# Altium project PGS-System.PrjPcb (part 9 of 16)

## Sheet RV1126_ETHERNET_SHEET.SchDoc
size A4; SheetNumber: 13; SheetTotal: 25
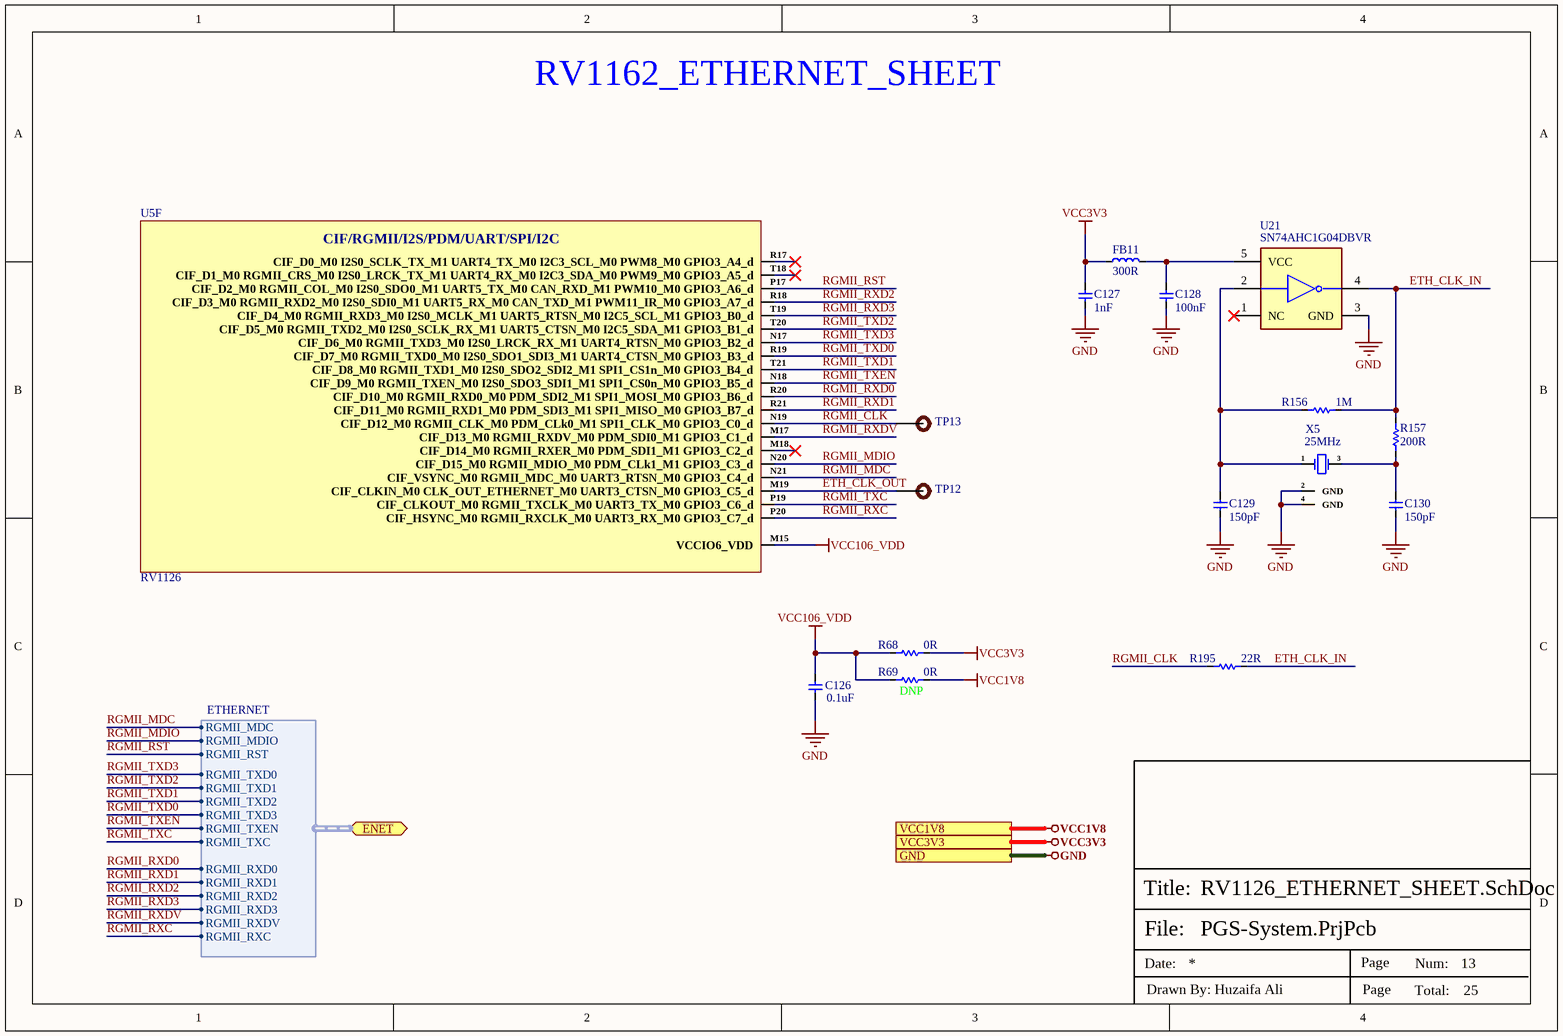
[diagram p13: RV1126_ETHERNET_SHEET.SchDoc]

### Parts
C126  0.1uF  [Cap-0402]
C127  1nF  [Cap-0402]
C128  100nF  [Cap-0402]
C129  150pF  [Cap-0402]
C130  150pF  [Cap-0402]
FB11  300R  [IND-0603 (1608 Metric)]
R68  0R  [Res-0402]
R69  DNP  [Res-0402]
R156  1M  [Res-0402]
R157  200R  [Res-0402]
R195  22R  [Res-0402]
TP12  TEST POINT 0.5mm Dia  [Test-point - 0.5mm]  (value not drawn)  (no BOM)
TP13  TEST POINT 0.5mm Dia  [Test-point - 0.5mm]  (value not drawn)  (no BOM)
U5  RV1126  [FCCSP-409(14x14)]  (part F of 15)
U21  SN74AHC1G04DBVR  [FP-DBV0005A-MFG]
X5  25MHz  [Q22FA12800090]

### Ports
ENET (bidir, harness ETHERNET, see ETHERNET_SWITCH_INTERFACE[2D]), GND (see DDR3_SDRAM_INTERFACE[4D], DIGITAL_MEMS_MIC_INTERFACE[3D], eMMC_INTERFACE[3D], ETHERNET_SWITCH_INTERFACE[5C], IR-CUT_LIGHT SENSOR_SHEET[3D], MIPI TO HDMI_MODULE_INTERFACE[3D], MIPI-CSI_RXX_INTERFACE[4C], PoE PD INTERFACE[3D], PoE_PSE_CONTROLLER[5D], POWER_LDO_SHEET[3D], POWER_PMIC_RK809_CODEC[3D], POWER_PMIC_RK809_DC DC[3D], POWER_PMIC_RK809_LDO[4C], POWER_PMIC_RK809_MANAGEMENT[3D], RV1126_AUDIO_SHEET[3D], RV1126_DRAM_SHEET[4C], RV1126_eMMC_SPI-FLASH_SHEET[3D], RV1126_OSC-PLL-PMUIO[3C], RV1126_POWER_SHEET[1D], RV1126_SARADC_SHEET[3C], SPI_FLASH_INTERFACE[3D], SYNCHRONOUS _BUCK_CONTROLLER[3D], USB2.0_DEBUG_UART[3D], WIFI_AP6256_SHEET[4D]), VCC1V8 (see DIGITAL_MEMS_MIC_INTERFACE[3D], IR-CUT_LIGHT SENSOR_SHEET[3D], MIPI TO HDMI_MODULE_INTERFACE[3D], MIPI-CSI_RXX_INTERFACE[4C], POWER_PMIC_RK809_LDO[4C], POWER_PMIC_RK809_MANAGEMENT[3D], RV1126_AUDIO_SHEET[3D], RV1126_OSC-PLL-PMUIO[3C], RV1126_SARADC_SHEET[3C], USB2.0_DEBUG_UART[3D], WIFI_AP6256_SHEET[4D]), VCC3V3 (see POWER_PMIC_RK809_LDO[4C], RV1126_SARADC_SHEET[3C], USB2.0_DEBUG_UART[3D], WIFI_AP6256_SHEET[4D])

### Harnesses
ETHERNET: RGMII_MDC, RGMII_MDIO, RGMII_RST, RGMII_TXD3, RGMII_TXD2, RGMII_TXD1, RGMII_TXD0, RGMII_TXEN, RGMII_TXC, RGMII_RXC, RGMII_RXDV, RGMII_RXD0, RGMII_RXD1, RGMII_RXD2, RGMII_RXD3

### Nets
GND: C126.1 C127.1 C128.1 C129.1 C130.1 U21.3(GND) X5.2(GND) X5.4(GND) ; port GND  [project net KSENSD]
VCC1V8: R69.2 ; port VCC1V8
VCC3V3: C127.2 FB11.2 R68.2 ; port VCC3V3
VCC106_VDD: C126.2 R68.1 R69.1 U5.M15(VCCIO6_VDD)
ETH_CLK_IN: R156.1 R157.2 R195.2 U21.4(Y)
ETH_CLK_OUT: TP12.1 U5.M19(CIF_CLKIN_M0_CLK_OUT_ETHERNET_M0_UART3_CTSN_M0_GPIO3_C5_d)
RGMII_CLK: R195.1 TP13.1 U5.N19(CIF_D12_M0_RGMII_CLK_M0_PDM_CLk0_M1_SPI1_CLK_M0_GPIO3_C0_d)
RGMII_MDC: U5.N21(CIF_VSYNC_M0_RGMII_MDC_M0_UART3_RTSN_M0_GPIO3_C4_d) ; port ENET.RGMII_MDC
RGMII_MDIO: U5.N20(CIF_D15_M0_RGMII_MDIO_M0_PDM_CLk1_M1_GPIO3_C3_d) ; port ENET.RGMII_MDIO
RGMII_RST: U5.P17(CIF_D2_M0_RGMII_COL_M0_I2S0_SDO0_M1_UART5_TX_M0_CAN_RXD_M1_PWM10_M0_GPIO3_A6_d) ; port ENET.RGMII_RST
RGMII_RXC: U5.P20(CIF_HSYNC_M0_RGMII_RXCLK_M0_UART3_RX_M0_GPIO3_C7_d) ; port ENET.RGMII_RXC
RGMII_RXD0: U5.R20(CIF_D10_M0_RGMII_RXD0_M0_PDM_SDI2_M1_SPI1_MOSI_M0_GPIO3_B6_d) ; port ENET.RGMII_RXD0
RGMII_RXD1: U5.R21(CIF_D11_M0_RGMII_RXD1_M0_PDM_SDI3_M1_SPI1_MISO_M0_GPIO3_B7_d) ; port ENET.RGMII_RXD1
RGMII_RXD2: U5.R18(CIF_D3_M0_RGMII_RXD2_M0_I2S0_SDI0_M1_UART5_RX_M0_CAN_TXD_M1_PWM11_IR_M0_GPIO3_A7_d) ; port ENET.RGMII_RXD2
RGMII_RXD3: U5.T19(CIF_D4_M0_RGMII_RXD3_M0_I2S0_MCLK_M1_UART5_RTSN_M0_I2C5_SCL_M1_GPIO3_B0_d) ; port ENET.RGMII_RXD3
RGMII_RXDV: U5.M17(CIF_D13_M0_RGMII_RXDV_M0_PDM_SDI0_M1_GPIO3_C1_d) ; port ENET.RGMII_RXDV
RGMII_TXC: U5.P19(CIF_CLKOUT_M0_RGMII_TXCLK_M0_UART3_TX_M0_GPIO3_C6_d) ; port ENET.RGMII_TXC
RGMII_TXD0: U5.R19(CIF_D7_M0_RGMII_TXD0_M0_I2S0_SDO1_SDI3_M1_UART4_CTSN_M0_GPIO3_B3_d) ; port ENET.RGMII_TXD3
RGMII_TXD1: U5.T21(CIF_D8_M0_RGMII_TXD1_M0_I2S0_SDO2_SDI2_M1_SPI1_CS1n_M0_GPIO3_B4_d) ; port ENET.RGMII_TXD2
RGMII_TXD2: U5.T20(CIF_D5_M0_RGMII_TXD2_M0_I2S0_SCLK_RX_M1_UART5_CTSN_M0_I2C5_SDA_M1_GPIO3_B1_d) ; port ENET.RGMII_TXD1
RGMII_TXD3: U5.N17(CIF_D6_M0_RGMII_TXD3_M0_I2S0_LRCK_RX_M1_UART4_RTSN_M0_GPIO3_B2_d) ; port ENET.RGMII_TXD0
RGMII_TXEN: U5.N18(CIF_D9_M0_RGMII_TXEN_M0_I2S0_SDO3_SDI1_M1_SPI1_CS0n_M0_GPIO3_B5_d) ; port ENET.RGMII_TXEN
NetC128_2: C128.2 FB11.1 U21.5(VCC)
NetC129_2: C129.2 R156.2 U21.2(A) X5.1(OSC1)
NetC130_2: C130.2 R157.1 X5.3(OSC2)

Not connected (* = marked no-connect by the designer): U5 M18(CIF_D14_M0_RGMII_RXER_M0_PDM_SDI1_M1_GPIO3_C2_d)* R17(CIF_D0_M0_I2S0_SCLK_TX_M1_UART4_TX_M0_I2C3_SCL_M0_PWM8_M0_GPIO3_A4_d)* T18(CIF_D1_M0_RGMII_CRS_M0_I2S0_LRCK_TX_M1_UART4_RX_M0_I2C3_SDA_M0_PWM9_M0_GPIO3_A5_d)*; U21 1(NC)*

### Notes on the sheet
- RV1162_ETHERNET_SHEET
- (near R69) 0R
- File:
- Title:
- Date:
- Page
- Num:
- Total:
- Drawn By: Huzaifa Ali
- (in symbol RV1126, part F) CIF/RGMII/I2S/PDM/UART/SPI/I2C

### Library data of the parts
C126 = CC0402KRX5R6BB104: as C33 on sheet POWER_PMIC_RK809_MGM; Supplier 1: Digi-Key; Manufacturer Part Number: CC0402KRX5R6BB104; RoHS: Yes; Category: Ceramic Capacitors; Stock 1: 6385580; Pricing 1: 1=0.10000, 10=0.02700, 50=0.01500, 100=0.01220, 500=0.00874, 1000=0.00687, 2500=0.00625, 5000=0.00575 (USD); Mount: Surface Mount; Case/Package: 0402; Number of Pins: 2; Case Code (Imperial): 0402; Case Code (Metric): 1005; Min Operating Temperature: -55°C; Max Operating Temperature: 85°C; Dielectric: X5R; Packaging: Tape and Reel; Voltage Rating: 10V; Package Quantity: 1; Termination: SMD/SMT; Voltage Rating (DC): 10V; Series: CC; Length: 1mm; Width: 0.02inch; Height: 0.5mm; Depth: 0.5mm; Thickness: 0.022inch; Radiation Hardening: No; RoHS Compliant: Yes; REACH SVHC: No SVHC; Lead Free: Lead Free; Halogen Free: Halogen Free; ComponentLink1URL: https://datasheet.ciiva.com/144/mlccorderingcode-144029.pdf?src-supplier=Digi-Key; ComponentLink1Description: https://datasheet.ciiva.com/144/mlccorderingcode-144029.pdf?src-supplier=Digi-Key; ComponentLink2URL: https://datasheet.ciiva.com/144/mlccorderingcode-144028.pdf?src-supplier=Digi-Key; ComponentLink2Description: https://datasheet.ciiva.com/144/mlccorderingcode-144028.pdf?src-supplier=Digi-Key; ComponentLink3URL: https://datasheet.ciiva.com/144/mlccorderingcode-144030.pdf?src-supplier=Digi-Key; ComponentLink3Description: https://datasheet.ciiva.com/144/mlccorderingcode-144030.pdf?src-supplier=Digi-Key; ComponentLink4URL: https://datasheet.ciiva.com/7978/1359354-7978091.pdf?src-supplier=Element14; ComponentLink4Description: https://datasheet.ciiva.com/7978/1359354-7978091.pdf?src-supplier=Element14; ComponentLink5URL: https://datasheet.ciiva.com/11587/upy-gphc-x5r-4v-to-50v-12-11587302.pdf?src-supplier=Avnet; ComponentLink5Description: https://datasheet.ciiva.com/11587/upy-gphc-x5r-4v-to-50v-12-11587302.pdf?src-supplier=Avnet; Supplier Part Number 1: 311-1336-1-ND; LCSC Part Number: C129131
C127 = C1005C0G1E102JT000F: CAP CER 1000PF 25V C0G 0402; Manufacturer: TDK; Item Type: Capacitor; ComponentLink1Description: LCSC; ComponentLink1URL: https://www.lcsc.com/product-detail/Multilayer-Ceramic-Capacitors-MLCC-SMD-SMT_TDK-C1005C0G1E102JT000F_C343059.html; Manufacturer Part Number: C1005C0G1E102JT000F; Package: 0402; LCSC Part Number: C343059
C128 = CC0402JRX7R7BB104: CAP CER 0.1UF 16V X7R 0402; Manufacturer: Yageo; Material: 4241ConductorMaterial; Tolerance: 5%; Item Type: Capacitor; Supplier: Digikey; Supplier Part Number: 311-1676-1-ND; Manufacturer Part Number: CC0402JRX7R7BB104; RoHS: Yes; Category: Ceramic Capacitors; Stock: 1659111; Pricing: 1=0.1, 10=0.046, 50=0.0262, 100=0.0203, 500=0.01528, 1000=0.012, 2500=0.01091, 5000=0.01004 (USD); Mounting Technology: Surface Mount; Case/Package: 0402; Case Code (Metric): 1005; Case Code (Imperial): 0402; Min Operating Temperature: -55°C; Max Operating Temperature: 125°C; Value: 100nF; Dielectric: X7R; Packaging: Tape and Reel; Package Quantity: 10000; Voltage Rating (DC): 16V; Voltage Rating: 16V; Series: CC; Construction: Flat; Length: 0.039inch; Width: 0.02inch; Height: 0.5mm; Thickness: 0.022inch; Lead Free: Lead Free; Halogen Free: Halogen Free; RoHS Compliant: Yes; ComponentLink1URL: https://datasheet.ciiva.com/13210/upy-gphc-x7r-6-3v-to-50v-8-12304-13210152.pdf?src-supplier=Mouser; ComponentLink1Description: https://datasheet.ciiva.com/13210/upy-gphc-x7r-6-3v-to-50v-8-12304-13210152.pdf?src-supplier=Mouser; LCSC Part Number: C541464
C129 C130 = CC0402KRX7R8BB151: CAP CER 150PF 25V X7R 0402; Manufacturer: Yageo; Tolerance: 10%; Item Type: Capacitor; Supplier: Future Electronics; Supplier Part Number: 2069488; Manufacturer Part Number: CC0402KRX7R8BB151; RoHS: Yes; Category: Ceramic Capacitors; Stock: 40000; Pricing: 10000=0.0032, 40000=0.003, 150000=0.0029, 400000=0.0028, 1000000=0.0026 (USD); Mounting Technology: Surface Mount; Case/Package: 0402; Case Code (Imperial): 0402; Case Code (Metric): 1005; Weight: 2.3E-05oz; Min Operating Temperature: -55°C; Max Operating Temperature: 125°C; Value: 150pF; Packaging: Tape and Reel; Voltage Rating (DC): 25V; Dielectric: X7R; Voltage Rating: 25V; Termination: SMD/SMT; Series: CC; Length: 0.039inch; Width: 0.02inch; Thickness: 0.022inch; Lead Free: Lead Free; Halogen Free: Halogen Free; RoHS Compliant: Yes; ComponentLink1URL: https://datasheet.ciiva.com/13210/upy-gphc-x7r-6-3v-to-50v-8-12304-13210062.pdf?src-supplier=Mouser; ComponentLink1Description: https://datasheet.ciiva.com/13210/upy-gphc-x7r-6-3v-to-50v-8-12304-13210062.pdf?src-supplier=Mouser; LCSC Part Number: C541384
FB11 = 742792641: FERRITE BEAD 300 OHM 0603 1LN; Manufacturer: Wurth Electronics; RMS Current (Irms): 2A; ESR: 150mR; Tolerance: 25%; Number of Lines: 1; Test Frequency: 100MHz; Value: 18nH; Supplier: Digikey; LCSC Part Number: C2649308; Manufacturer Part Number: 742792641; RoHS: Yes; Item Type: Ferrite Bead; Stock: 95770; Pricing: 1=0.18, 50=0.179, 100=0.165, 500=0.158, 1000=0.15, 2000=0.143 (USD); Mounting Technology: Surface Mount; Case/Package: SMD/SMT; Weight: 0.000141oz; Core Material: Ferrite; Case Code (Metric): 1608; Case Code (Imperial): 0603; Material: Ferrite; Min Operating Temperature: -55°C; Max Operating Temperature: 125°C; Package Quantity: 1; Current Rating: 2A; Packaging: Tape and Reel; Impedance: 300R; Max Current Rating: 2A; Max DC Current: 2A; Termination: SMD/SMT; Series: WE-CBF; Length: 1.6mm; Width: 0.8mm; Height: 0.8mm; Depth: 0.8mm; Lead Free: Lead Free; Reach SVHC Compliant: Unknown; RoHS Compliant: Yes; ComponentLink1URL: https://datasheet.ciiva.com/1466/1705830-1466501.pdf?src-supplier=Element14; ComponentLink1Description: https://datasheet.ciiva.com/1466/1705830-1466501.pdf?src-supplier=Element14; ComponentLink2URL: https://datasheet.ciiva.com/11800/0900766b80d2e072-11800409.pdf?src-supplier=Rs; ComponentLink2Description: https://datasheet.ciiva.com/11800/0900766b80d2e072-11800409.pdf?src-supplier=Rs; ComponentLink3URL: https://datasheet.ciiva.com/4940/742792641-72209-4940450.pdf?src-supplier=Mouser; ComponentLink3Description: https://datasheet.ciiva.com/4940/742792641-72209-4940450.pdf?src-supplier=Mouser; ComponentLink4URL: https://datasheet.ciiva.com/1013/742792641-1013888.pdf?src-supplier=Digikey; ComponentLink4Description: https://datasheet.ciiva.com/1013/742792641-1013888.pdf?src-supplier=Digikey; ComponentLink5URL: https://datasheet.ciiva.com/1466/1705830-1466502.pdf?src-supplier=Element14; ComponentLink5Description: https://datasheet.ciiva.com/1466/1705830-1466502.pdf?src-supplier=Element14; ComponentLink6URL: https://datasheet.ciiva.com/1013/742792641-1013889.pdf?src-supplier=Digikey; ComponentLink6Description: https://datasheet.ciiva.com/1013/742792641-1013889.pdf?src-supplier=Digikey
R68 = RC0402FR-070RL: as R20 on sheet POWER_PMIC_RK809_CODEC; Supplier 1: Mouser; Manufacturer Part Number: RC0402FR-070RL; RoHS: Yes; Stock 1: 8556842; Pricing 1: 1=0.10000, 10=0.01400, 50=0.01400, 100=0.00600, 1000=0.00300, 5000=0.00200, 10000=0.00100 (USD); Mount: Surface Mount; Case/Package: 0402; Contact Plating: Tin,Matte; Case Code (Imperial): 0402; Case Code (Metric): 1005; Size Code: 0402; Min Operating Temperature: -55°C; Max Operating Temperature: 155°C; Resistance: 0R; Resistor Type: Thick Film; Packaging: Tape and Reel; Termination: SMD/SMT; Features: Moisture Resistant; Series: RC; Number of Terminations: 2; Length: 1mm; Width: 0.5mm; Height: 0.35mm; Radiation Hardening: No; Lead Free: Lead Free; RoHS Compliant: Yes; ComponentLink1URL: https://datasheet.ciiva.com/8896/pyu-rc0402-51-rohs-l-6-8896149.pdf?src-supplier=Avnet; ComponentLink1Description: https://datasheet.ciiva.com/8896/pyu-rc0402-51-rohs-l-6-8896149.pdf?src-supplier=Avnet; ComponentLink2URL: https://datasheet.ciiva.com/16790/pyu-rc0402-51-rohs-l-6-r-16790444.pdf?src-supplier=Future+Electronics; ComponentLink2Description: https://datasheet.ciiva.com/16790/pyu-rc0402-51-rohs-l-6-r-16790444.pdf?src-supplier=Future+Electronics; Supplier Part Number 1: 603-RC0402FR-070RL; LCSC Part Number: C106231
R69 = RC0402FR-070RL: RES 0 OHM JUMPER 1/16W 0402; Manufacturer: Yageo; Item Type: Resistors; Resistance: 0R; Tolerance: 1%; Power Rating: 62.5mW; Voltage Rating: 50V; Temperature Coefficient: 200ppm/°C; Max Power Dissipation: 63mW; Supplier 1: Mouser; Manufacturer Part Number: RC0402FR-070RL; RoHS: Yes; Stock 1: 8556842; Pricing 1: 1=0.10000, 10=0.01400, 50=0.01400, 100=0.00600, 1000=0.00300, 5000=0.00200, 10000=0.00100 (USD); Mount: Surface Mount; Case/Package: 0402; Contact Plating: Tin,Matte; Case Code (Imperial): 0402; Case Code (Metric): 1005; Size Code: 0402; Min Operating Temperature: -55°C; Max Operating Temperature: 155°C; Resistor Type: Thick Film; Packaging: Tape and Reel; Termination: SMD/SMT; Features: Moisture Resistant; Series: RC; Number of Terminations: 2; Length: 1mm; Width: 0.5mm; Height: 0.35mm; Radiation Hardening: No; Lead Free: Lead Free; RoHS Compliant: Yes; ComponentLink1URL: https://datasheet.ciiva.com/8896/pyu-rc0402-51-rohs-l-6-8896149.pdf?src-supplier=Avnet; ComponentLink1Description: https://datasheet.ciiva.com/8896/pyu-rc0402-51-rohs-l-6-8896149.pdf?src-supplier=Avnet; ComponentLink2URL: https://datasheet.ciiva.com/16790/pyu-rc0402-51-rohs-l-6-r-16790444.pdf?src-supplier=Future+Electronics; ComponentLink2Description: https://datasheet.ciiva.com/16790/pyu-rc0402-51-rohs-l-6-r-16790444.pdf?src-supplier=Future+Electronics; Supplier Part Number 1: 603-RC0402FR-070RL; LCSC Part Number: C106231
R156 = AF0402JR-071ML: RES SMD 1M OHM 5% 1/16W 0402; Manufacturer: Yageo; Resistance: 1MR; Max Power Dissipation: 63mW; Temperature Coefficient: 100ppm/°C; Item Type: Resistor; Supplier 1: Digi-Key; Manufacturer Part Number: AF0402JR-071ML; Stock 1: 0; Pricing 1: 10000=0.00408 (USD); Case/Package: 0402; Min Operating Temperature: -55°C; Max Operating Temperature: 155°C; Packaging: Tape and Reel; Resistor Type: Thick Film; Number of Terminations: 2; Tolerance: 5%; Features: Moisture Resistant,Anti-Sulfur; Length: 0.039inch; Width: 0.02inch; Height: 0.015inch; RoHS Compliant: Yes; ComponentLink1URL: https://www.yageo.com/upload/media/product/productsearch/datasheet/rchip/PYu-AF_51_RoHS_L_6.pdf?src-supplier=Digi-Key; ComponentLink1Description: https://www.yageo.com/upload/media/product/productsearch/datasheet/rchip/PYu-AF_51_RoHS_L_6.pdf?src-supplier=Digi-Key; Supplier Part Number 1: AF0402JR-071ML-ND; LCSC Part Number: C144054
R157 = RC0402FR-07200RL: RES 200 OHM 1% 1/16W 0402; Manufacturer: Yageo; Temperature Coefficient: 100ppm/°C; Power Rating: 63mW; Voltage Rating (DC): 50V; Supplier 1: Digi-Key; Manufacturer Part Number: RC0402FR-07200RL; RoHS: Yes; Category: Chip SMD Resistors; Stock 1: 19778; Pricing 1: 1=0.10000, 10=0.01600, 100=0.00660, 1000=0.00299, 2500=0.00259, 5000=0.00214 (USD); Case/Package: 0402; Case Code (Metric): 1005; Case Code (Imperial): 0402; Size Code: 0402; Min Operating Temperature: -55°C; Max Operating Temperature: 155°C; Tolerance: 1%; Resistance: 200R; Resistor Type: Thick Film; Packaging: Tape and Reel; Voltage Rating: 50V; Package Quantity: 1; Number of Terminations: 2; Termination: SMD/SMT; Max Power Dissipation: 63mW; Features: Moisture Resistant; Series: RC; Construction: Rectangular; Resistance Tolerance: 1%; Length: 1mm; Width: 0.02inch; Height: 0.016inch; Depth: 0.5mm; REACH SVHC: No SVHC; Lead Free: Lead Free; RoHS Compliant: Yes; Military Standard: Not; ComponentLink1URL: https://datasheet.ciiva.com/2553/pyu-r-int-thick-7-2553232.pdf?src-supplier=Digi-Key; ComponentLink1Description: https://datasheet.ciiva.com/2553/pyu-r-int-thick-7-2553232.pdf?src-supplier=Digi-Key; ComponentLink2URL: https://datasheet.ciiva.com/7983/1018594-7983509.pdf?src-supplier=Element14; ComponentLink2Description: https://datasheet.ciiva.com/7983/1018594-7983509.pdf?src-supplier=Element14; ComponentLink3URL: https://datasheet.ciiva.com/16804/pyu-rc0402-51-rohs-l-6-r-16804406.pdf?src-supplier=Future+Electronics; ComponentLink3Description: https://datasheet.ciiva.com/16804/pyu-rc0402-51-rohs-l-6-r-16804406.pdf?src-supplier=Future+Electronics; ComponentLink4URL: https://datasheet.ciiva.com/15189/getdatasheetpartid-331152-15189383.pdf?src-supplier=Verical; ComponentLink4Description: https://datasheet.ciiva.com/15189/getdatasheetpartid-331152-15189383.pdf?src-supplier=Verical; ComponentLink5URL: https://datasheet.ciiva.com/7849/1018594-7849898.pdf?src-supplier=Element14; ComponentLink5Description: https://datasheet.ciiva.com/7849/1018594-7849898.pdf?src-supplier=Element14; ComponentLink6URL: https://datasheet.ciiva.com/5562/pyu-rc0402-51-rohs-l-6-r-8721-5562539.pdf?src-supplier=Mouser; ComponentLink6Description: https://datasheet.ciiva.com/5562/pyu-rc0402-51-rohs-l-6-r-8721-5562539.pdf?src-supplier=Mouser; ComponentLink7URL: https://datasheet.ciiva.com/7849/1018594-7849899.pdf?src-supplier=Element14; ComponentLink7Description: https://datasheet.ciiva.com/7849/1018594-7849899.pdf?src-supplier=Element14; ComponentLink8URL: https://datasheet.ciiva.com/2553/pyu-r-int-thick-7-2553230.pdf?src-supplier=Digi-Key; ComponentLink8Description: https://datasheet.ciiva.com/2553/pyu-r-int-thick-7-2553230.pdf?src-supplier=Digi-Key; ComponentLink9URL: https://datasheet.ciiva.com/2553/pyu-r-int-thick-7-2553231.pdf?src-supplier=Digi-Key; ComponentLink9Description: https://datasheet.ciiva.com/2553/pyu-r-int-thick-7-2553231.pdf?src-supplier=Digi-Key; Supplier Part Number 1: 311-200LRCT-ND; LCSC Part Number: C114764
R195 = RC0402FR-0722RL: as R10 on sheet POWER_PMIC_RK809_MGM; Supplier 1: Avnet; Manufacturer Part Number: RC0402FR-0722RL; RoHS: Yes; Category: Chip SMD Resistors; Stock 1: 1810000; Pricing 1: 10000=0.00085 (USD); Case/Package: 0402; Number of Pins: 2; Case Code (Imperial): 0402; Case Code (Metric): 1005; Size Code: 0402; Min Operating Temperature: -55°C; Max Operating Temperature: 155°C; Resistor Type: Thick Film; Voltage Rating (DC): 50V; Resistance: 22R; Tolerance: 1%; Packaging: Tape and Reel; Termination: SMD/SMT; Features: Moisture Resistant; Series: RC; Number of Terminations: 2; Resistance Tolerance: 1%; Technology: THICK FILM; Construction: Rectangular; Length: 1mm; Width: 0.5mm; Height: 0.32mm; Depth: 0.5mm; RoHS Compliant: Yes; Reach SVHC Compliant: Yes; Military Standard: Not; Lead Free: Lead Free; ComponentLink1URL: https://datasheet.ciiva.com/11819/0900766b80c66297-11819462.pdf?src-supplier=RSComponents; ComponentLink1Description: https://datasheet.ciiva.com/11819/0900766b80c66297-11819462.pdf?src-supplier=RSComponents; ComponentLink2URL: https://datasheet.ciiva.com/7849/1018594-7849912.pdf?src-supplier=Element14; ComponentLink2Description: https://datasheet.ciiva.com/7849/1018594-7849912.pdf?src-supplier=Element14; ComponentLink3URL: https://datasheet.ciiva.com/7849/1018594-7849911.pdf?src-supplier=Element14; ComponentLink3Description: https://datasheet.ciiva.com/7849/1018594-7849911.pdf?src-supplier=Element14; ComponentLink4URL: https://datasheet.ciiva.com/16930/pyu-rc0402-51-rohs-l-6-r-16930687.pdf?src-supplier=Future+Electronics; ComponentLink4Description: https://datasheet.ciiva.com/16930/pyu-rc0402-51-rohs-l-6-r-16930687.pdf?src-supplier=Future+Electronics; ComponentLink5URL: https://datasheet.ciiva.com/26829/getdatasheetpartid-554995-26829991.pdf?src-supplier=Verical; ComponentLink5Description: https://datasheet.ciiva.com/26829/getdatasheetpartid-554995-26829991.pdf?src-supplier=Verical; Supplier Part Number 1: RC0402FR-0722RL; LCSC Part Number: C114765
TP12 TP13 = TEST POINT 0.5mm Dia: Test Point ON; Item Type: Test Point; Manufacturer Part Number: TEST POINT 0.5mm Dia
U5 = RV1126: as U5 on sheet RV1126_POWER_SHEET; Manufacturer Part Number: RV1126; Package: FCCSP-409(14x14); LCSC Part Number: C2859017; Item Type: Microcontroller; ComponentLink1Description: LCSC; ComponentLink1URL: https://www.lcsc.com/product-detail/Microcontroller-Units-MCUs-MPUs-SOCs_Rockchip-RV1126_C2859017.html
U21 = CMP-0859-00023-4: IC INVERTER 1CH 1-INP SOT23-5; Manufacturer: Texas Instruments; Nominal Supply Current: 1uA; Number Of Circuits: 1; Logic Function Desc: Inverting; Max Junction Temp: +150°C; Max Supply Voltage: 5.5V; Min Supply Voltage: 2V; Standoff Height: 0mm; Propagation Delay: 5.3ns; Ambient Temperature Range High: +125°C; Ambient Temperature Range Low: -40°C; Category: IC; ComponentLink2Description: Datasheet; Octopart: https://octopart.com/sn74ahc1g04dbvr-texas+instruments-464402; Temperature Range Low: -40°C; Height: 1.45mm; Digikey Description: IC INVERTER 1CH 1-INP SOT23-5; RoHS: TRUE; Temperature Range High: +125°C; Device Class L2: Logic ICs; ComponentLink2URL: http://www.ti.com/lit/ds/symlink/sn74ahc1g04.pdf; Package: DBV0005A; Automotive: No; Device Class L3: Logic Gates; Number Of Outputs: 1; Number Of Inputs: 1; Lead Free: Yes; Mouser Description: IC: digital; inverter; Channels: 1; Inputs: 1; SMD; SOT23-5; 2÷5.5VDC; Temperature: -40°C to +125°C; Device Class L1: Integrated Circuits (ICs); Manufacturer Part Number: SN74AHC1G04DBVR; Ipc Land Pattern Name: SOT95P280X145-5
X5 = Q22FA12800090: CRYSTAL 25.0000MHZ 12PF SMD; Manufacturer: Seiko Epson; ComponentLink1Description: LCSC; ComponentLink1URL: https://www.lcsc.com/product-detail/Crystals_Seiko-Epson-Q22FA12800090_C255883.html; Manufacturer Part Number: Q22FA12800090; Package: SMD2016-4P; LCSC Part Number: C255883; Item Type: Crystal

## Sheet RV1126_eMMC_SPI-FLASH.SchDoc
size A4; SheetNumber: 14; SheetTotal: 26
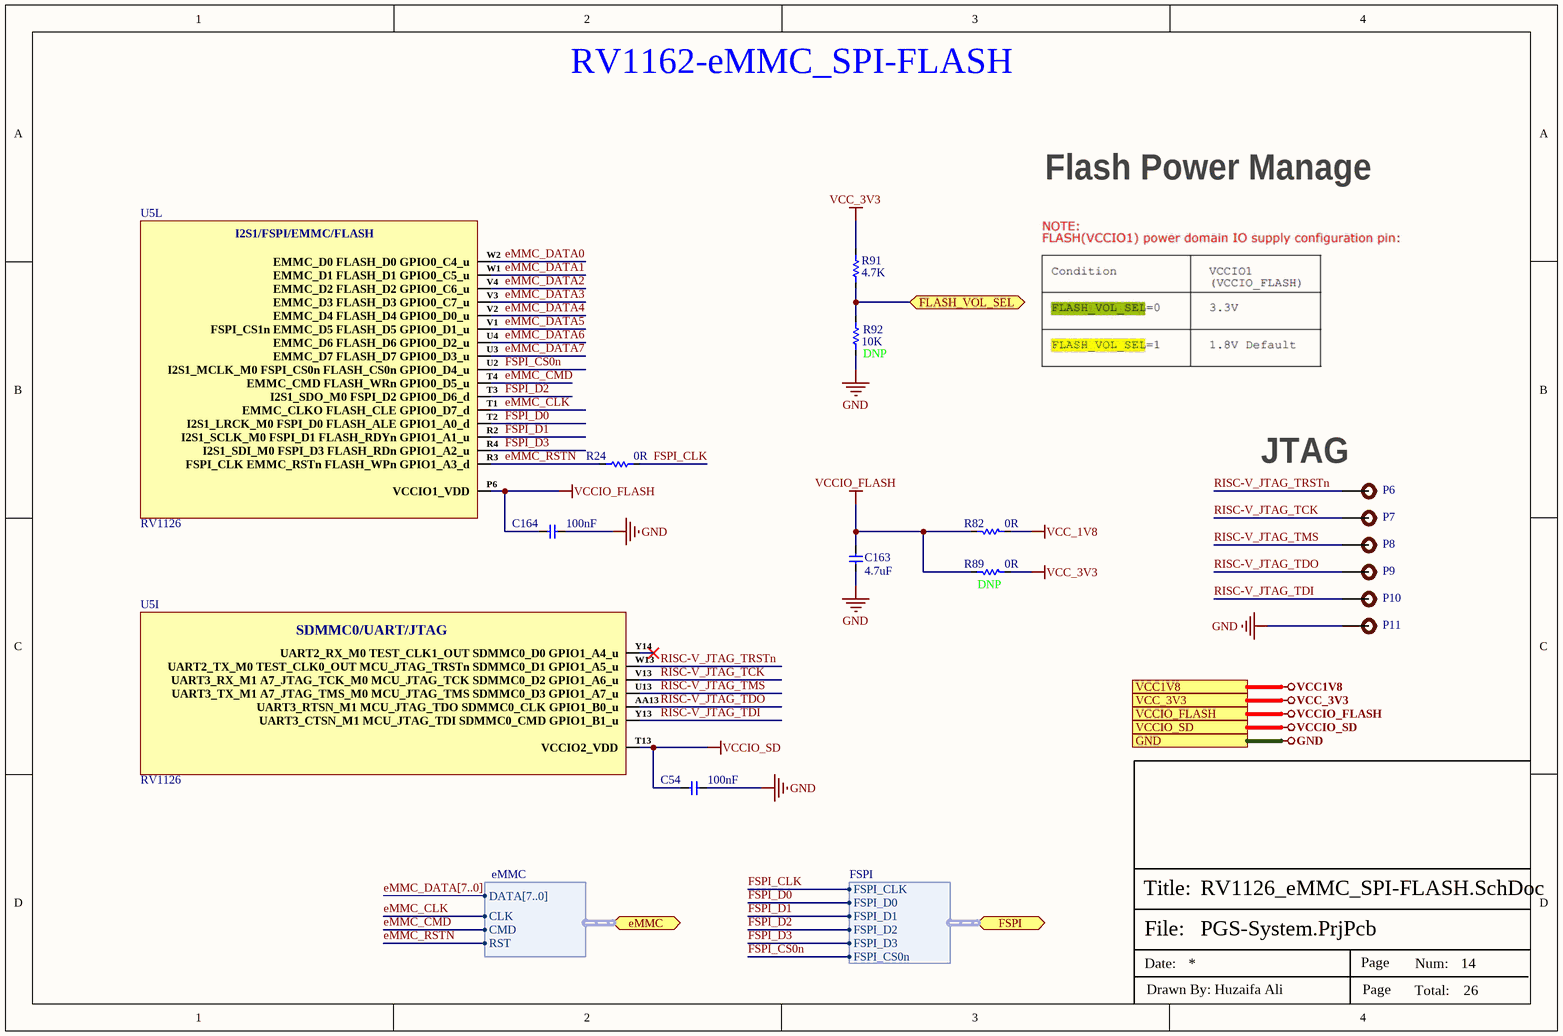
[diagram p14: RV1126_eMMC_SPI-FLASH.SchDoc]

### Parts
C54  100nF  [CAP-0201]
C163  4.7uF  [Cap-0402]
C164  100nF  [CAP-0201]
P6  TEST POINT 0.5mm Dia  [Test-point - 0.5mm]  (value not drawn)  (no BOM)
P7  TEST POINT 0.5mm Dia  [Test-point - 0.5mm]  (value not drawn)  (no BOM)
P8  TEST POINT 0.5mm Dia  [Test-point - 0.5mm]  (value not drawn)  (no BOM)
P9  TEST POINT 0.5mm Dia  [Test-point - 0.5mm]  (value not drawn)  (no BOM)
P10  TEST POINT 0.5mm Dia  [Test-point - 0.5mm]  (value not drawn)  (no BOM)
P11  TEST POINT 0.5mm Dia  [Test-point - 0.5mm]  (value not drawn)  (no BOM)
R24  0R  [Res-0402]
R82  0R  [Res-0603]
R89  DNP  [Res-0603]
R91  4.7K  [Res-0402]
R92  DNP  [Res-0402]
U5  RV1126  [FCCSP-409(14x14)]  (parts I,L of 15)

### Ports
eMMC (bidir, harness eMMC, see eMMC_INTERFACE[2D]), FLASH_VOL_SEL (bidir, see RV1126_OSC-PLL-PMUIO[3D]), FSPI (bidir, harness FSPI, see SPI_FLASH_INTERFACE[2D]), GND (see DDR3_SDRAM_INTERFACE[5D], DEBUG_UART_INTERFACE[3D], DIGITAL_MEMS_MIC_INTERFACE[3C], eMMC_INTERFACE[3D], ETHERNET_SWITCH_INTERFACE[5D], IR-CUT_LIGHT SENSOR_SHEET[3D], MIPI TO HDMI_MODULE_INTERFACE[3D], MIPI-CSI_RXX_INTERFACE[4C], PoE PD INTERFACE[3D], PoE_PSE_CONTROLLER[5D], POWER_LDO_SHEET[3D], POWER_PMIC_RK809_CODEC[3D], POWER_PMIC_RK809_DC DC[3D], POWER_PMIC_RK809_LDO[4C], POWER_PMIC_RK809_MANAGEMENT[3D], RV1126_AUDIO_SHEET[3D], RV1126_DRAM_SHEET[4C], RV1126_ETHERNET_SHEET[3D], RV1126_OSC-PLL-PMUIO[3C], RV1126_POWER_SHEET[1D], RV1126_SARADC_SHEET[3C], SPI_FLASH_INTERFACE[3D], SYNCHRONOUS _BUCK_CONTROLLER[3D], USB2.0_DEBUG_UART[3D], WIFI_AP6256_SHEET[3C]), VCC1V8 (see DIGITAL_MEMS_MIC_INTERFACE[3C], IR-CUT_LIGHT SENSOR_SHEET[3D], MIPI TO HDMI_MODULE_INTERFACE[3D], MIPI-CSI_RXX_INTERFACE[4C], POWER_PMIC_RK809_LDO[4C], POWER_PMIC_RK809_MANAGEMENT[3D], RV1126_AUDIO_SHEET[3D], RV1126_ETHERNET_SHEET[3D], RV1126_OSC-PLL-PMUIO[3C], RV1126_SARADC_SHEET[3C], USB2.0_DEBUG_UART[3D], WIFI_AP6256_SHEET[3C]), VCC_3V3 (see eMMC_INTERFACE[3D]), VCCIO_FLASH (see eMMC_INTERFACE[3D], SPI_FLASH_INTERFACE[3D]), VCCIO_SD (see POWER_PMIC_RK809_LDO[4C])

### Harnesses
FSPI: FSPI_D2, FSPI_CLK, FSPI_D0, FSPI_D1, FSPI_CS0n, FSPI_D3
eMMC: DATA[7..0], CLK, CMD, RST

### Nets
GND: C54.1 C163.1 C164.1 P11.1 R92.2 ; port GND  [project net KSENSD]
VCC_1V8: R82.1
VCC_3V3: R89.1 R91.1 ; port VCC_3V3
VCCIO_FLASH: C163.2 C164.2 R82.2 R89.2 U5.P6(VCCIO1_VDD) ; port VCCIO_FLASH
VCCIO_SD: C54.2 U5.T13(VCCIO2_VDD) ; port VCCIO_SD
eMMC_CLK: U5.T1(EMMC_CLKO_FLASH_CLE_GPIO0_D7_d) ; port eMMC.CLK
eMMC_CMD: U5.T4(EMMC_CMD_FLASH_WRn_GPIO0_D5_u) ; port eMMC.CMD
eMMC_DATA0: U5.W2(EMMC_D0_FLASH_D0_GPIO0_C4_u)
eMMC_DATA1: U5.W1(EMMC_D1_FLASH_D1_GPIO0_C5_u)
eMMC_DATA2: U5.V4(EMMC_D2_FLASH_D2_GPIO0_C6_u)
eMMC_DATA3: U5.V3(EMMC_D3_FLASH_D3_GPIO0_C7_u)
eMMC_DATA4: U5.V2(EMMC_D4_FLASH_D4_GPIO0_D0_u)
eMMC_DATA5: U5.V1(FSPI_CS1n_EMMC_D5_FLASH_D5_GPIO0_D1_u)
eMMC_DATA6: U5.U4(EMMC_D6_FLASH_D6_GPIO0_D2_u)
eMMC_DATA7: U5.U3(EMMC_D7_FLASH_D7_GPIO0_D3_u)
eMMC_RSTN: R24.1 U5.R3(FSPI_CLK_EMMC_RSTn_FLASH_WPn_GPIO1_A3_d) ; port eMMC.RST
FLASH_VOL_SEL: R91.2 R92.1 ; port FLASH_VOL_SEL
FSPI_CLK: R24.2 ; port FSPI.FSPI_CLK
FSPI_CS0n: U5.U2(I2S1_MCLK_M0_FSPI_CS0n_FLASH_CS0n_GPIO0_D4_u) ; port FSPI.FSPI_CS0n
FSPI_D0: U5.T2(I2S1_LRCK_M0_FSPI_D0_FLASH_ALE_GPIO1_A0_d) ; port FSPI.FSPI_D0
FSPI_D1: U5.R2(I2S1_SCLK_M0_FSPI_D1_FLASH_RDYn_GPIO1_A1_u) ; port FSPI.FSPI_D1
FSPI_D2: U5.T3(I2S1_SDO_M0_FSPI_D2_GPIO0_D6_d) ; port FSPI.FSPI_D2
FSPI_D3: U5.R4(I2S1_SDI_M0_FSPI_D3_FLASH_RDn_GPIO1_A2_u) ; port FSPI.FSPI_D3
RISC-V_JTAG_TCK: P7.1 U5.V13(UART3_RX_M1_A7_JTAG_TCK_M0_MCU_JTAG_TCK_SDMMC0_D2_GPIO1_A6_u)
RISC-V_JTAG_TDI: P10.1 U5.Y13(UART3_CTSN_M1_MCU_JTAG_TDI_SDMMC0_CMD_GPIO1_B1_u)
RISC-V_JTAG_TDO: P9.1 U5.AA13(UART3_RTSN_M1_MCU_JTAG_TDO_SDMMC0_CLK_GPIO1_B0_u)
RISC-V_JTAG_TMS: P8.1 U5.U13(UART3_TX_M1_A7_JTAG_TMS_M0_MCU_JTAG_TMS_SDMMC0_D3_GPIO1_A7_u)
RISC-V_JTAG_TRSTn: P6.1 U5.W13(UART2_TX_M0_TEST_CLK0_OUT_MCU_JTAG_TRSTn_SDMMC0_D1_GPIO1_A5_u)

Not connected (* = marked no-connect by the designer): U5 Y14(UART2_RX_M0_TEST_CLK1_OUT_SDMMC0_D0_GPIO1_A4_u)*

### Buses and harness runs
bus eMMC_DATA[7..0]

### Notes on the sheet
- RV1162-eMMC_SPI-FLASH
- Flash Power Manage
- (near R92) 10K
- JTAG
- (near R89) 0R
- File:
- Title:
- Date:
- Page
- Num:
- Total:
- Drawn By: Huzaifa Ali
- (in symbol RV1126, part I) SDMMC0/UART/JTAG
- (in symbol RV1126, part L) I2S1/FSPI/EMMC/FLASH

### Library data of the parts
C54 C164 = CC0201KRX5R6BB104: as C88-C91 on sheet RV1126_POWER_SHEET; Supplier 1: Mouser; Manufacturer Part Number: CC0201KRX5R6BB104; RoHS: Yes; Category: Ceramic Capacitors; Stock 1: 824403; Pricing 1: 1=0.10000, 10=0.02400, 50=0.02400, 100=0.01900, 1000=0.01100, 10000=0.00900 (USD); Mount: Surface Mount; Case/Package: 0201; Case Code (Imperial): 0201; Case Code (Metric): 0603; Weight: 6E-06oz; Min Operating Temperature: -55°C; Max Operating Temperature: 85°C; Capacitance: 100nF; Dielectric: X5R; Voltage Rating (DC): 10V; Packaging: Tape and Reel; Termination: SMD/SMT; Resistor Type: Ceramic; Voltage Rating: 10V; Series: CC; Construction: Flat; Length: 0.6mm; Width: 0.012inch; Height: 0.3mm; Thickness: 0.013inch; Depth: 0.3mm; Radiation Hardening: No; Lead Free: Lead Free; Halogen Free: Halogen Free; RoHS Compliant: Yes; ComponentLink1URL: https://datasheet.ciiva.com/11587/upy-gphc-x5r-4v-to-50v-12-11587190.pdf?src-supplier=Avnet; ComponentLink1Description: https://datasheet.ciiva.com/11587/upy-gphc-x5r-4v-to-50v-12-11587190.pdf?src-supplier=Avnet; Supplier Part Number 1: 603-CC201KRX5R6BB104; LCSC Part Number: C190183
C163 = CC0402KRX5R6BB475: CAP CER 4.7UF 10V X5R 0402; Manufacturer: Yageo; Tolerance: 10%; Supplier 1: Farnell; Manufacturer Part Number: CC0402KRX5R6BB475; RoHS: Yes; Category: Ceramic Capacitors; Stock 1: 20000; Pricing 1: 10000=0.02310, 50000=0.02100 (GBP); Mount: Surface Mount; Case/Package: 0402; Case Code (Imperial): 0402; Case Code (Metric): 1005; Min Operating Temperature: -55°C; Max Operating Temperature: 85°C; Packaging: Cut Tape; Capacitance: 4.7uF; Voltage Rating: 10V; RoHS Compliant: Yes; ComponentLink1URL: http://www.yageo.com/documents/recent/UPY-GPHC_X5R_4V-to-50V_25.pdf?src-supplier=Digi-Key; ComponentLink1Description: http://www.yageo.com/documents/recent/UPY-GPHC_X5R_4V-to-50V_25.pdf?src-supplier=Digi-Key; Supplier Part Number 1: 3871698; LCSC Part Number: C326586
P6-P11 = TEST POINT 0.5mm Dia: Test Point ON; Item Type: Test Point; Manufacturer Part Number: TEST POINT 0.5mm Dia
R24 = RC0402FR-070RL: RES 0 OHM JUMPER 1/16W 0402; Manufacturer: Yageo; Tolerance: 1%; Power Rating: 62.5mW; Voltage Rating: 50V; Temperature Coefficient: 200ppm/°C; Max Power Dissipation: 63mW; Supplier 1: Mouser; Manufacturer Part Number: RC0402FR-070RL; RoHS: Yes; Category: Chip SMD Resistors; Stock 1: 8556842; Pricing 1: 1=0.10000, 10=0.01400, 50=0.01400, 100=0.00600, 1000=0.00300, 5000=0.00200, 10000=0.00100 (USD); Mount: Surface Mount; Case/Package: 0402; Contact Plating: Tin,Matte; Case Code (Imperial): 0402; Case Code (Metric): 1005; Size Code: 0402; Min Operating Temperature: -55°C; Max Operating Temperature: 155°C; Resistance: 0R; Resistor Type: Thick Film; Packaging: Tape and Reel; Termination: SMD/SMT; Features: Moisture Resistant; Series: RC; Number of Terminations: 2; Length: 1mm; Width: 0.5mm; Height: 0.35mm; Radiation Hardening: No; Lead Free: Lead Free; RoHS Compliant: Yes; ComponentLink1URL: https://datasheet.ciiva.com/8896/pyu-rc0402-51-rohs-l-6-8896149.pdf?src-supplier=Avnet; ComponentLink1Description: https://datasheet.ciiva.com/8896/pyu-rc0402-51-rohs-l-6-8896149.pdf?src-supplier=Avnet; ComponentLink2URL: https://datasheet.ciiva.com/16790/pyu-rc0402-51-rohs-l-6-r-16790444.pdf?src-supplier=Future+Electronics; ComponentLink2Description: https://datasheet.ciiva.com/16790/pyu-rc0402-51-rohs-l-6-r-16790444.pdf?src-supplier=Future+Electronics; Supplier Part Number 1: 603-RC0402FR-070RL; LCSC Part Number: C106231
R82 R89 = RC0603FR-070RL: RES SMD 0R, 1%, 0.1W, 0603; Manufacturer: Yageo; Item Type: Resistor; Manufacturer Part Number: RC0603FR-070RL; Package: 0603; LCSC Part Number: C100044; ComponentLink9Description: LCSC; ComponentLink9URL: https://www.lcsc.com/product-detail/Chip-Resistor-Surface-Mount_YAGEO-RC0603FR-070RL_C100044.html
R91 = RC0402FR-074K7L: as R11 on sheet POWER_PMIC_RK809_MGM; Supplier 1: Avnet; Manufacturer Part Number: RC0402FR-074K7L; RoHS: Yes; Category: Chip SMD Resistors; Stock 1: 2420000; Pricing 1: 10000=0.00085 (USD); Case/Package: 0402; Number of Pins: 2; Case Code (Imperial): 0402; Case Code (Metric): 1005; Size Code: 0402; Min Operating Temperature: -55°C; Max Operating Temperature: 155°C; Tolerance: 1%; Voltage Rating: 50V; Packaging: Tape and Reel; Resistor Type: Thick Film; Termination: SMD/SMT; Features: Moisture Resistant; Series: RC; Number of Terminations: 2; Resistance Tolerance: 1%; Construction: Rectangular; Length: 1mm; Width: 0.5mm; Height: 0.32mm; Depth: 0.5mm; Height - Seated (Max): 0.016inch; RoHS Compliant: Yes; Reach SVHC Compliant: Yes; Military Standard: Not; Lead Free: Lead Free; ComponentLink1URL: https://datasheet.ciiva.com/22661/1686128-22661342.pdf?src-supplier=Element14; ComponentLink1Description: https://datasheet.ciiva.com/22661/1686128-22661342.pdf?src-supplier=Element14; ComponentLink2URL: https://datasheet.ciiva.com/7850/1018594-7850022.pdf?src-supplier=Element14; ComponentLink2Description: https://datasheet.ciiva.com/7850/1018594-7850022.pdf?src-supplier=Element14; ComponentLink3URL: https://datasheet.ciiva.com/7850/1018594-7850023.pdf?src-supplier=Element14; ComponentLink3Description: https://datasheet.ciiva.com/7850/1018594-7850023.pdf?src-supplier=Element14; ComponentLink4URL: https://datasheet.ciiva.com/15215/getdatasheetpartid-328119-15215035.pdf?src-supplier=Verical; ComponentLink4Description: https://datasheet.ciiva.com/15215/getdatasheetpartid-328119-15215035.pdf?src-supplier=Verical; Supplier Part Number 1: RC0402FR-074K7L; LCSC Part Number: C105871
R92 = RC0402FR-0710KL: as R9 on sheet POWER_PMIC_RK809_MGM; Supplier 1: Mouser; Manufacturer Part Number: RC0402FR-0710KL; RoHS: Yes; Category: Chip SMD Resistors; Stock 1: 18648329; Pricing 1: 1=0.10000, 10=0.01400, 50=0.01400, 100=0.00500, 1000=0.00300, 10000=0.00200 (USD); Case/Package: 0402; Number of Pins: 2; Case Code (Imperial): 0402; Case Code (Metric): 1005; Min Operating Temperature: -55°C; Max Operating Temperature: 155°C; Resistor Type: Thick Film; Tolerance: 1%; Packaging: Tape and Reel; Voltage Rating: 50V; Termination: SMD/SMT; Working Voltage: 50V; Number of Terminations: 2; Features: Moisture Resistant; Series: RC; Resistance Tolerance: 1%; Construction: Rectangular; Length: 1mm; Width: 0.5mm; Height: 0.32mm; Depth: 0.5mm; Lead Pitch: 0.2mm; REACH SVHC: No SVHC; Lead Free: Lead Free; RoHS Compliant: Yes; Military Standard: Not; ComponentLink1URL: https://datasheet.ciiva.com/7660/38568-7660787.pdf?src-supplier=Element14; ComponentLink1Description: https://datasheet.ciiva.com/7660/38568-7660787.pdf?src-supplier=Element14; ComponentLink2URL: https://datasheet.ciiva.com/7849/1686128-7849814.pdf?src-supplier=Element14; ComponentLink2Description: https://datasheet.ciiva.com/7849/1686128-7849814.pdf?src-supplier=Element14; ComponentLink3URL: https://datasheet.ciiva.com/7983/1018594-7983486.pdf?src-supplier=Element14; ComponentLink3Description: https://datasheet.ciiva.com/7983/1018594-7983486.pdf?src-supplier=Element14; ComponentLink4URL: https://datasheet.ciiva.com/22747/1018594-22747512.pdf?src-supplier=Element14; ComponentLink4Description: https://datasheet.ciiva.com/22747/1018594-22747512.pdf?src-supplier=Element14; ComponentLink5URL: https://datasheet.ciiva.com/12667/pyu-rc0402-51-rohs-l-6-r-12667067.pdf?src-supplier=Mouser; ComponentLink5Description: https://datasheet.ciiva.com/12667/pyu-rc0402-51-rohs-l-6-r-12667067.pdf?src-supplier=Mouser; ComponentLink6URL: https://datasheet.ciiva.com/7849/1784430-7849813.pdf?src-supplier=Element14; ComponentLink6Description: https://datasheet.ciiva.com/7849/1784430-7849813.pdf?src-supplier=Element14; ComponentLink7URL: https://datasheet.ciiva.com/7849/1784430-7849815.pdf?src-supplier=Element14; ComponentLink7Description: https://datasheet.ciiva.com/7849/1784430-7849815.pdf?src-supplier=Element14; Supplier Part Number 1: 603-RC0402FR-0710KL; LCSC Part Number: C60490
U5 = RV1126: as U5 on sheet RV1126_POWER_SHEET; Manufacturer Part Number: RV1126; Package: FCCSP-409(14x14); LCSC Part Number: C2859017; Item Type: Microcontroller; ComponentLink1Description: LCSC; ComponentLink1URL: https://www.lcsc.com/product-detail/Microcontroller-Units-MCUs-MPUs-SOCs_Rockchip-RV1126_C2859017.html

## Sheet RV1126_OSC-PLL-PMUIO.SchDoc
size A4; SheetNumber: 16; SheetTotal: 28
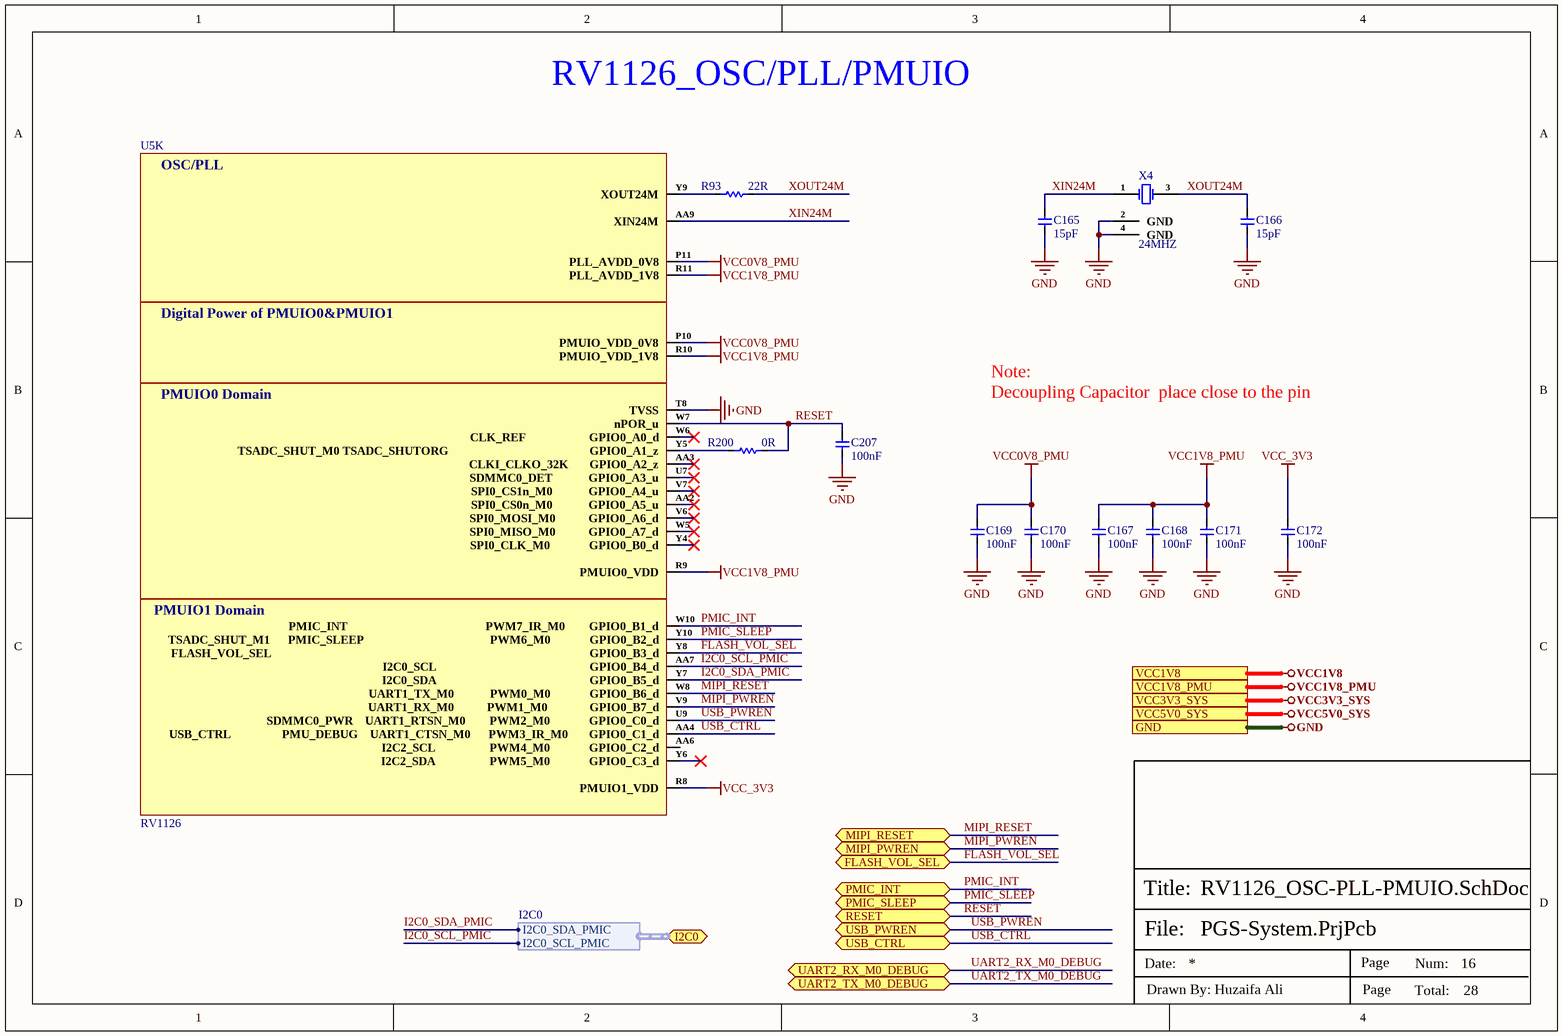
[diagram p15: RV1126_OSC-PLL-PMUIO.SchDoc]

### Parts
C165  15pF  [Cap-0201]
C166  15pF  [Cap-0201]
C167  100nF  [CAP-0201]
C168  100nF  [CAP-0201]
C169  100nF  [CAP-0201]
C170  100nF  [CAP-0201]
C171  100nF  [CAP-0201]
C172  100nF  [CAP-0201]
C207  100nF  [CAP-0201]
R93  22R  [Res-0402]
R200  0R  [Res-0402]
U5  RV1126  [FCCSP-409(14x14)]  (part K of 15)
X4  24MHZ  [X322524MOB4SI-]

### Ports
FLASH_VOL_SEL (bidir, see RV1126_eMMC_SPI-FLASH[3B]), GND (see BUCK_CONTROLLER_SHEET2[3D], BUCK_CONVERTER_SHEET1[3D], DDR3_SDRAM_SHEET[5D], DEBUG_UART_INTERFACE[3D], DIGITAL_MEMS_INTERFACE[3C], eMMC_INTERFACE[3D], ETH_PoE-PD_INTERFACE[4D], ETH_SWITCH_INTERFACE[5D], IR-CUT_LIGHT SENSOR_SHEET[3D], MIPI TO HDMI_MODULE[3D], MIPI-CSI_RXX_INTERFACE[3C], PoE_PSE_CONTROLLER[5D], POWER_LDO_SHEET[3D], POWER_PMIC_RK809_CODEC[3C], POWER_PMIC_RK809_DC DC[3D], POWER_PMIC_RK809_LDO[4C], POWER_PMIC_RK809_MGM[3D], RV1126_AUDIO_SHEET[3D], RV1126_DRAM_SHEET[4C], RV1126_eMMC_SPI-FLASH[3C], RV1126_ETHERNET_SHEET[3D], RV1126_POWER_SHEET[1D], RV1126_SARADC_SHEET[3C], RV1126_SDMMC_SHEET[3C], SPEARKER_INTERFACE_SHEET[3C], SPI_FLASH_INTERFACE[3D], USB2.0_DEBUG_UART[3D]), I2C0 (bidir, harness I2C0, see POWER_PMIC_RK809_MGM[2D]), MIPI_PWREN (bidir, see MIPI TO HDMI_MODULE[3D]), MIPI_RESET (bidir, see MIPI TO HDMI_MODULE[3D]), PMIC_INT (bidir, see POWER_PMIC_RK809_MGM[1D]), PMIC_SLEEP (bidir, see POWER_PMIC_RK809_MGM[1D]), RESET (bidir, see POWER_PMIC_RK809_MGM[1D]), UART2_RX_M0_DEBUG (bidir, see DEBUG_UART_INTERFACE[2D], RV1126_SARADC_SHEET[2D]), UART2_TX_M0_DEBUG (bidir, see DEBUG_UART_INTERFACE[2D], RV1126_SARADC_SHEET[2D]), USB_CTRL (bidir, see USB2.0_DEBUG_UART[2D]), USB_PWREN (bidir, see USB2.0_DEBUG_UART[2D]), VCC1V8 (see DIGITAL_MEMS_INTERFACE[3C], IR-CUT_LIGHT SENSOR_SHEET[3D], MIPI TO HDMI_MODULE[3D], MIPI-CSI_RXX_INTERFACE[3C], POWER_PMIC_RK809_LDO[4C], POWER_PMIC_RK809_MGM[3D], RV1126_AUDIO_SHEET[3D], RV1126_eMMC_SPI-FLASH[3C], RV1126_ETHERNET_SHEET[3D], RV1126_SARADC_SHEET[3C], RV1126_SDMMC_SHEET[3C], USB2.0_DEBUG_UART[3D]), VCC1V8_PMU (see POWER_PMIC_RK809_LDO[4C], POWER_PMIC_RK809_MGM[3D]), VCC3V3_SYS (see MIPI TO HDMI_MODULE[3D], POWER_PMIC_RK809_DC DC[3D], POWER_PMIC_RK809_LDO[4C], POWER_PMIC_RK809_MGM[3D]), VCC5V0_SYS (see BUCK_CONVERTER_SHEET1[3D], IR-CUT_LIGHT SENSOR_SHEET[3D], MIPI TO HDMI_MODULE[3D], POWER_LDO_SHEET[3D], POWER_PMIC_RK809_CODEC[3C], POWER_PMIC_RK809_DC DC[3D], POWER_PMIC_RK809_LDO[4C], POWER_PMIC_RK809_MGM[3D], USB2.0_DEBUG_UART[3D])

### Harnesses
I2C0: I2C0_SDA_PMIC, I2C0_SCL_PMIC

### Nets
GND: C165.1 C166.1 C167.1 C168.1 C169.1 C170.1 C171.1 C172.1 C207.1 U5.T8(TVSS) X4.2(GND) X4.4(GND) ; port GND  [project net KSENSD]
VCC0V8_PMU: C169.2 C170.2 U5.P10(PMUIO_VDD_0V8) U5.P11(PLL_AVDD_0V8)
VCC1V8_PMU: C167.2 C168.2 C171.2 U5.R9(PMUIO0_VDD) U5.R10(PMUIO_VDD_1V8) U5.R11(PLL_AVDD_1V8) ; port VCC1V8_PMU
VCC_3V3: C172.2 U5.R8(PMUIO1_VDD)
FLASH_VOL_SEL: U5.Y8(FLASH_VOL_SEL__________________________________________________________________________________________________________GPIO0_B3_d) ; port FLASH_VOL_SEL
I2C0_SCL_PMIC: U5.AA7(I2C0_SCL___________________________________________________GPIO0_B4_d) ; port I2C0.I2C0_SCL_PMIC
I2C0_SDA_PMIC: U5.Y7(I2C0_SDA___________________________________________________GPIO0_B5_d) ; port I2C0.I2C0_SDA_PMIC
MIPI_PWREN: U5.V9(UART1_RX_M0___________PWM1_M0______________GPIO0_B7_d) ; port MIPI_PWREN
MIPI_RESET: U5.W8(UART1_TX_M0____________PWM0_M0_____________GPIO0_B6_d) ; port MIPI_RESET
PMIC_INT: U5.W10(PMIC_INT______________________________________________PWM7_IR_M0________GPIO0_B1_d) ; port PMIC_INT
PMIC_SLEEP: U5.Y10(TSADC_SHUT_M1______PMIC_SLEEP__________________________________________PWM6_M0_____________GPIO0_B2_d) ; port PMIC_SLEEP
RESET: C207.2 R200.2 U5.W7(nPOR_u) ; port RESET
USB_CTRL: U5.AA4(USB_CTRL_________________PMU_DEBUG____UART1_CTSN_M0______PWM3_IR_M0_______GPIO0_C1_d) ; port USB_CTRL
USB_PWREN: U5.U9(SDMMC0_PWR____UART1_RTSN_M0________PWM2_M0_____________GPIO0_C0_d) ; port USB_PWREN
XIN24M: C165.2 U5.AA9(XIN24M) X4.1(CRYSTAL)
XOUT24M: C166.2 R93.2 X4.3(CRYSTAL)
NetR93_1: R93.1 U5.Y9(XOUT24M)
NetR200_1: R200.1 U5.Y5(TSADC_SHUT_M0_TSADC_SHUTORG_______________________________________________GPIO0_A1_z)

Not connected (* = marked no-connect by the designer): U5 AA2(SPI0_CS0n_M0____________GPIO0_A5_u)* AA3(CLKI_CLKO_32K_______GPIO0_A2_z)* AA6(I2C2_SCL__________________PWM4_M0_____________GPIO0_C2_d) U7(SDMMC0_DET____________GPIO0_A3_u)* V6(SPI0_MOSI_M0___________GPIO0_A6_d)* V7(SPI0_CS1n_M0____________GPIO0_A4_u)* W5(SPI0_MISO_M0___________GPIO0_A7_d)* W6(CLK_REF_____________________GPIO0_A0_d)* Y4(SPI0_CLK_M0_____________GPIO0_B0_d)* Y6(I2C2_SDA__________________PWM5_M0_____________GPIO0_C3_d)*

### Notes on the sheet
- RV1126_OSC/PLL/PMUIO
- Note:
- Decoupling Capacitor  place close to the pin
- File:
- Title:
- Date:
- Page
- Num:
- Total:
- Drawn By: Huzaifa Ali
- (in symbol RV1126, part K) OSC/PLL; Digital Power of PMUIO0&PMUIO1; PMUIO0 Domain; PMUIO1 Domain

### Library data of the parts
C165 C166 = CC0201JRNPO9BN150: CAP CER 15PF 50V C0G/NPO 0201; Manufacturer: Yageo; Item Type: Capacitor; Supplier: Future Electronics; Supplier Part Number: 2580314; Manufacturer Part Number: CC0201JRNPO9BN150; RoHS: Yes; Category: Ceramic Capacitors; Stock: 585000; Pricing: 15000=0.0012, 60000=0.0011, 225000=0.0011, 600000=0.001, 1500000=0.001 (USD); ComponentLink1URL: https://datasheet.ciiva.com/176/mlccorderingcode-176501.pdf?src-supplier=Digi-Key; ComponentLink1Description: https://datasheet.ciiva.com/176/mlccorderingcode-176501.pdf?src-supplier=Digi-Key; ComponentLink2URL: https://datasheet.ciiva.com/176/mlccorderingcode-176502.pdf?src-supplier=Digi-Key; ComponentLink2Description: https://datasheet.ciiva.com/176/mlccorderingcode-176502.pdf?src-supplier=Digi-Key; ComponentLink3URL: https://datasheet.ciiva.com/176/mlccorderingcode-176503.pdf?src-supplier=Digi-Key; ComponentLink3Description: https://datasheet.ciiva.com/176/mlccorderingcode-176503.pdf?src-supplier=Digi-Key; ComponentLink4URL: https://datasheet.ciiva.com/17205/upy-gp-np0-16v-to-50v-8-17205625.pdf?src-supplier=Future+Electronics; ComponentLink4Description: https://datasheet.ciiva.com/17205/upy-gp-np0-16v-to-50v-8-17205625.pdf?src-supplier=Future+Electronics; LCSC Part Number: C277480
C167-C172 C207 = CC0201KRX5R6BB104: as C88-C91 on sheet RV1126_POWER_SHEET; Supplier 1: Mouser; Manufacturer Part Number: CC0201KRX5R6BB104; RoHS: Yes; Category: Ceramic Capacitors; Stock 1: 824403; Pricing 1: 1=0.10000, 10=0.02400, 50=0.02400, 100=0.01900, 1000=0.01100, 10000=0.00900 (USD); Mount: Surface Mount; Case/Package: 0201; Case Code (Imperial): 0201; Case Code (Metric): 0603; Weight: 6E-06oz; Min Operating Temperature: -55°C; Max Operating Temperature: 85°C; Capacitance: 100nF; Dielectric: X5R; Voltage Rating (DC): 10V; Packaging: Tape and Reel; Termination: SMD/SMT; Resistor Type: Ceramic; Voltage Rating: 10V; Series: CC; Construction: Flat; Length: 0.6mm; Width: 0.012inch; Height: 0.3mm; Thickness: 0.013inch; Depth: 0.3mm; Radiation Hardening: No; Lead Free: Lead Free; Halogen Free: Halogen Free; RoHS Compliant: Yes; ComponentLink1URL: https://datasheet.ciiva.com/11587/upy-gphc-x5r-4v-to-50v-12-11587190.pdf?src-supplier=Avnet; ComponentLink1Description: https://datasheet.ciiva.com/11587/upy-gphc-x5r-4v-to-50v-12-11587190.pdf?src-supplier=Avnet; Supplier Part Number 1: 603-CC201KRX5R6BB104; LCSC Part Number: C190183
R93 = RC0402FR-0722RL: as R10 on sheet POWER_PMIC_RK809_MGM; Supplier 1: Avnet; Manufacturer Part Number: RC0402FR-0722RL; RoHS: Yes; Category: Chip SMD Resistors; Stock 1: 1810000; Pricing 1: 10000=0.00085 (USD); Case/Package: 0402; Number of Pins: 2; Case Code (Imperial): 0402; Case Code (Metric): 1005; Size Code: 0402; Min Operating Temperature: -55°C; Max Operating Temperature: 155°C; Resistor Type: Thick Film; Voltage Rating (DC): 50V; Resistance: 22R; Tolerance: 1%; Packaging: Tape and Reel; Termination: SMD/SMT; Features: Moisture Resistant; Series: RC; Number of Terminations: 2; Resistance Tolerance: 1%; Technology: THICK FILM; Construction: Rectangular; Length: 1mm; Width: 0.5mm; Height: 0.32mm; Depth: 0.5mm; RoHS Compliant: Yes; Reach SVHC Compliant: Yes; Military Standard: Not; Lead Free: Lead Free; ComponentLink1URL: https://datasheet.ciiva.com/11819/0900766b80c66297-11819462.pdf?src-supplier=RSComponents; ComponentLink1Description: https://datasheet.ciiva.com/11819/0900766b80c66297-11819462.pdf?src-supplier=RSComponents; ComponentLink2URL: https://datasheet.ciiva.com/7849/1018594-7849912.pdf?src-supplier=Element14; ComponentLink2Description: https://datasheet.ciiva.com/7849/1018594-7849912.pdf?src-supplier=Element14; ComponentLink3URL: https://datasheet.ciiva.com/7849/1018594-7849911.pdf?src-supplier=Element14; ComponentLink3Description: https://datasheet.ciiva.com/7849/1018594-7849911.pdf?src-supplier=Element14; ComponentLink4URL: https://datasheet.ciiva.com/16930/pyu-rc0402-51-rohs-l-6-r-16930687.pdf?src-supplier=Future+Electronics; ComponentLink4Description: https://datasheet.ciiva.com/16930/pyu-rc0402-51-rohs-l-6-r-16930687.pdf?src-supplier=Future+Electronics; ComponentLink5URL: https://datasheet.ciiva.com/26829/getdatasheetpartid-554995-26829991.pdf?src-supplier=Verical; ComponentLink5Description: https://datasheet.ciiva.com/26829/getdatasheetpartid-554995-26829991.pdf?src-supplier=Verical; Supplier Part Number 1: RC0402FR-0722RL; LCSC Part Number: C114765
R200 = RC0402FR-070RL: as R20 on sheet POWER_PMIC_RK809_CODEC; Supplier 1: Mouser; Manufacturer Part Number: RC0402FR-070RL; RoHS: Yes; Stock 1: 8556842; Pricing 1: 1=0.10000, 10=0.01400, 50=0.01400, 100=0.00600, 1000=0.00300, 5000=0.00200, 10000=0.00100 (USD); Mount: Surface Mount; Case/Package: 0402; Contact Plating: Tin,Matte; Case Code (Imperial): 0402; Case Code (Metric): 1005; Size Code: 0402; Min Operating Temperature: -55°C; Max Operating Temperature: 155°C; Resistance: 0R; Resistor Type: Thick Film; Packaging: Tape and Reel; Termination: SMD/SMT; Features: Moisture Resistant; Series: RC; Number of Terminations: 2; Length: 1mm; Width: 0.5mm; Height: 0.35mm; Radiation Hardening: No; Lead Free: Lead Free; RoHS Compliant: Yes; ComponentLink1URL: https://datasheet.ciiva.com/8896/pyu-rc0402-51-rohs-l-6-8896149.pdf?src-supplier=Avnet; ComponentLink1Description: https://datasheet.ciiva.com/8896/pyu-rc0402-51-rohs-l-6-8896149.pdf?src-supplier=Avnet; ComponentLink2URL: https://datasheet.ciiva.com/16790/pyu-rc0402-51-rohs-l-6-r-16790444.pdf?src-supplier=Future+Electronics; ComponentLink2Description: https://datasheet.ciiva.com/16790/pyu-rc0402-51-rohs-l-6-r-16790444.pdf?src-supplier=Future+Electronics; Supplier Part Number 1: 603-RC0402FR-070RL; LCSC Part Number: C106231
U5 = RV1126: as U5 on sheet RV1126_POWER_SHEET; Manufacturer Part Number: RV1126; Package: FCCSP-409(14x14); LCSC Part Number: C2859017; Item Type: Microcontroller; ComponentLink1Description: LCSC; ComponentLink1URL: https://www.lcsc.com/product-detail/Microcontroller-Units-MCUs-MPUs-SOCs_Rockchip-RV1126_C2859017.html
X4 = X322524MOB4SI: 24MHz SMD Crystal Resonator 12pF ±10ppm ±30ppm -40℃~+85℃ SMD3225-4P Crystals ROHS; Manufacturer: Yangxing Tech; ComponentLink1Description: LCSC; ComponentLink1URL: https://www.lcsc.com/product-detail/Crystals_Yangxing-Tech-X322524MOB4SI_C70590.html; Manufacturer Part Number: X322524MOB4SI; Footprint: Custom; LCSC Part Number: C70590; Item Type: Crystal